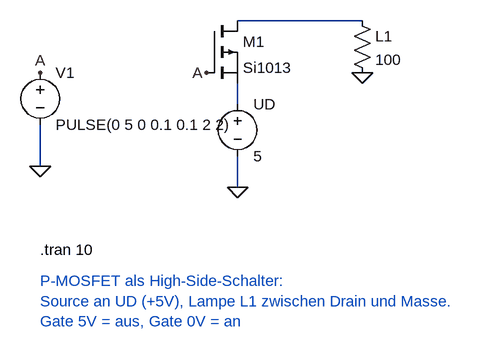
[diagram p0: schematic mosfet_lampe_pmos.asc]
mosfet_lampe_pmos.asc, the LTspice schematic file:
Version 4.1
SHEET 1 1440 700
WIRE 400 96 208 96
WIRE 208 224 208 192
WIRE -96 320 -96 256
WIRE 208 352 208 304
FLAG 208 352 0
FLAG -96 320 0
FLAG -96 176 A
FLAG 160 176 A
FLAG 400 176 0
SYMBOL pmos 160 96 R0
SYMATTR InstName M1
SYMATTR Value Si1013
SYMBOL res 384 80 R0
SYMATTR InstName L1
SYMATTR Value 100
SYMBOL voltage 208 208 R0
SYMATTR InstName UD
SYMATTR Value 5
SYMBOL voltage -96 160 R0
WINDOW 123 0 0 Left 0
WINDOW 39 0 0 Left 0
SYMATTR InstName V1
SYMATTR Value PULSE(0 5 0 0.1 0.1 2 2)
TEXT -96 448 Left 2 !.tran 10
TEXT -96 496 Left 2 ;P-MOSFET als High-Side-Schalter: \nSource an UD (+5V), Lampe L1 zwischen Drain und Masse. \nGate 5V = aus, Gate 0V = an

The netlist it stands for:
* mosfet_lampe_pmos.asc
M1 N001 A N002 N002 Si1013
R§L1 N001 0 100
V§UD N002 0 5
V1 A 0 PULSE(0 5 0 0.1 0.1 2 2)
.model NMOS NMOS
.model PMOS PMOS
.lib standard.mos
.tran 10
* P-MOSFET als High-Side-Schalter:
* Source an UD (+5V), Lampe L1 zwischen Drain und Masse.
* Gate 5V = aus, Gate 0V = an
.backanno
.end